# Altium schematic sheet 01_CPU_Core.SchDoc
size A1; SheetNumber: 12; SheetTotal: 12; SPICEModelCacheKMGZATEG: <root> / <DocumentId>KMGZATEG</DocumentId> / </root>
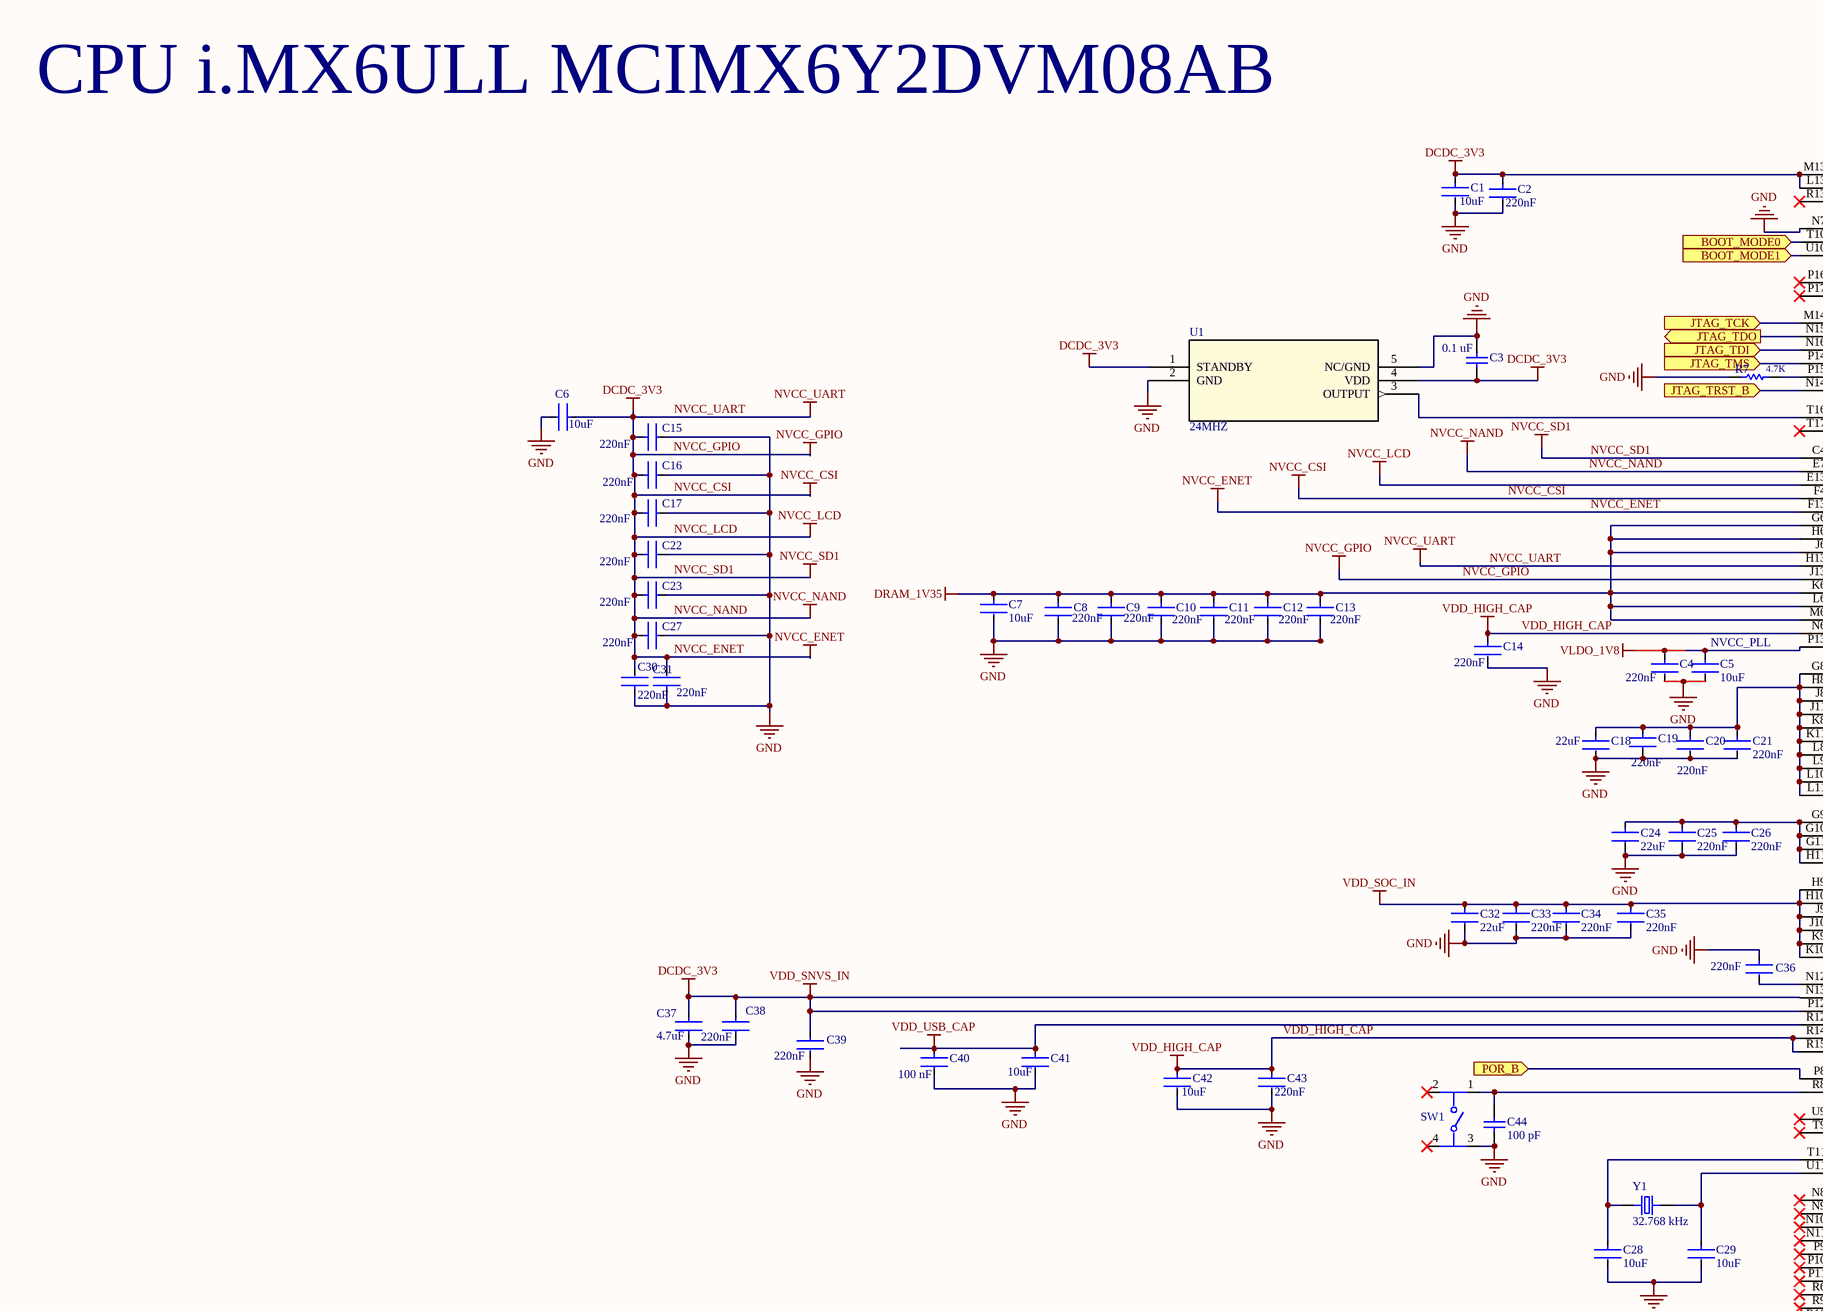
[diagram p0: 01_CPU_Core.SchDoc, top left]
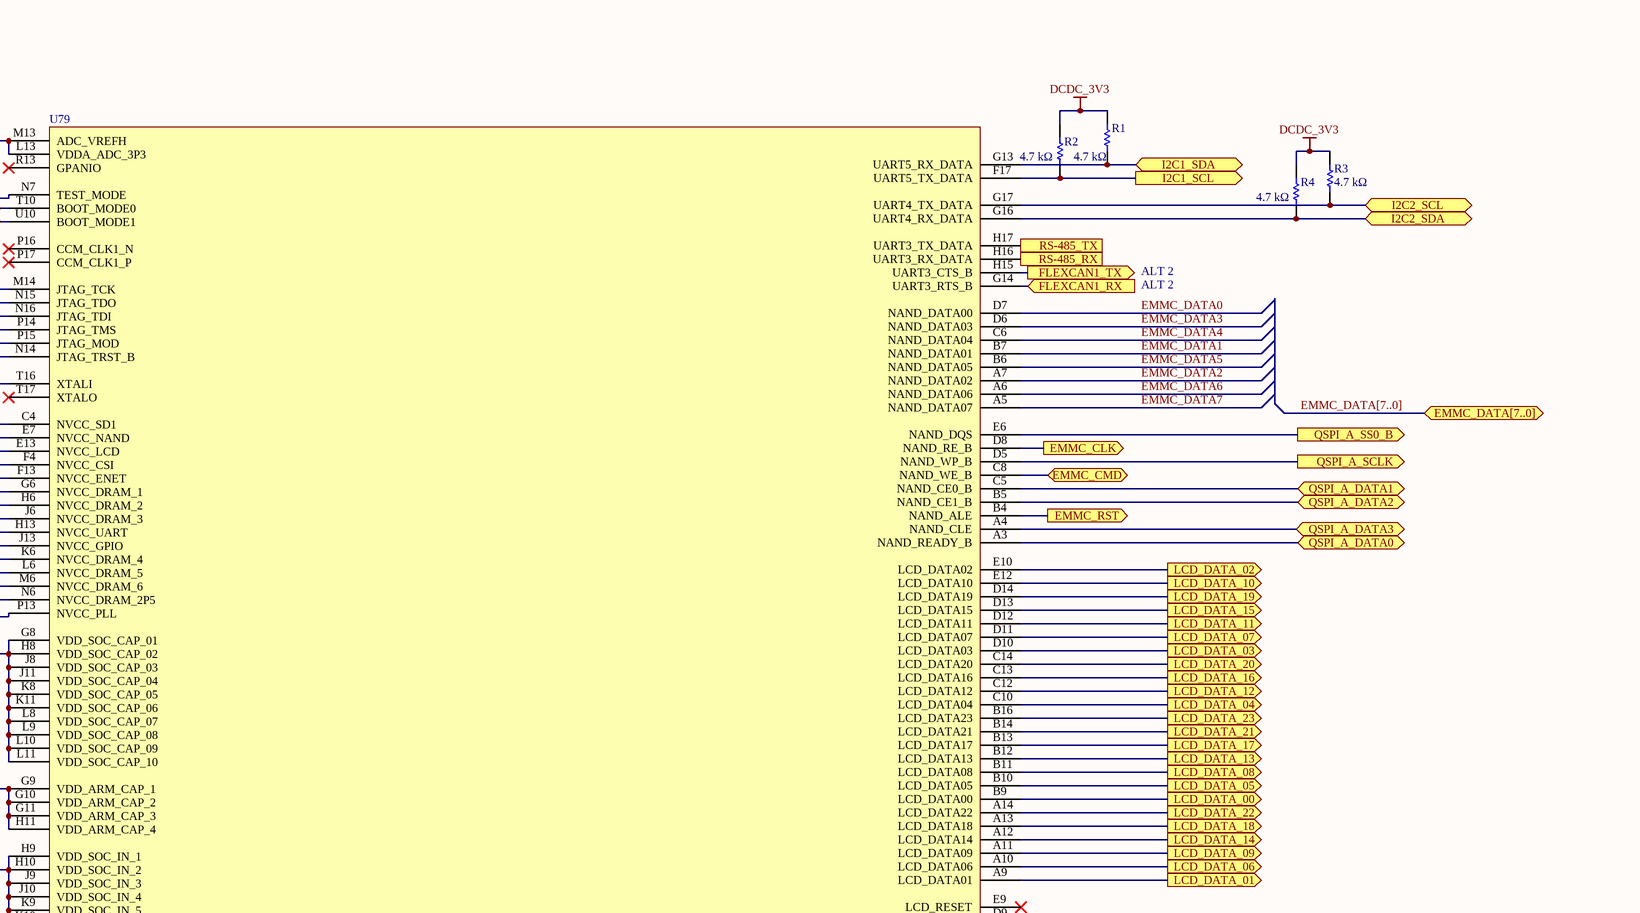
[diagram p1: 01_CPU_Core.SchDoc, top right]
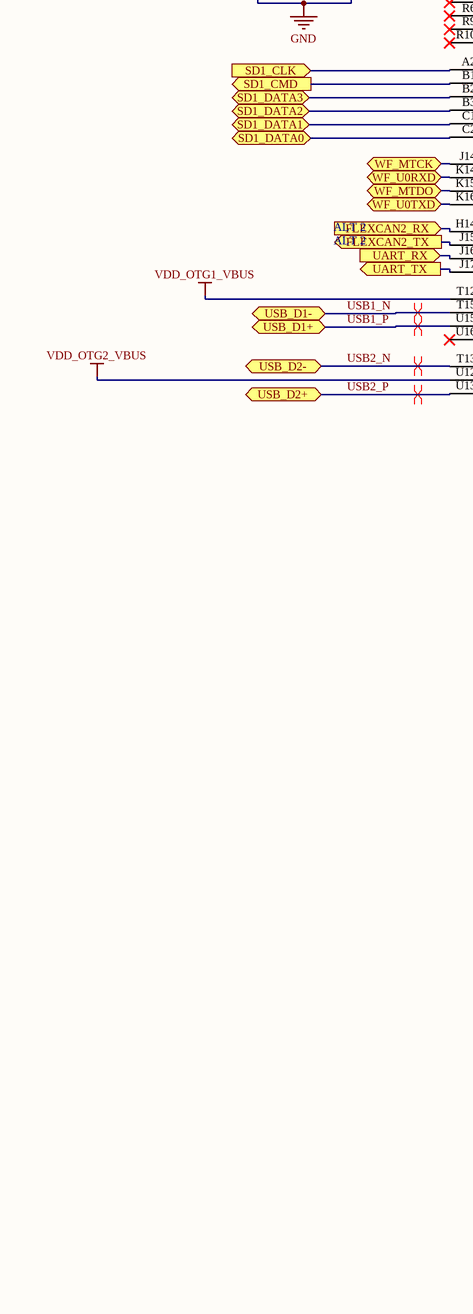
[diagram p2: 01_CPU_Core.SchDoc, bottom left]
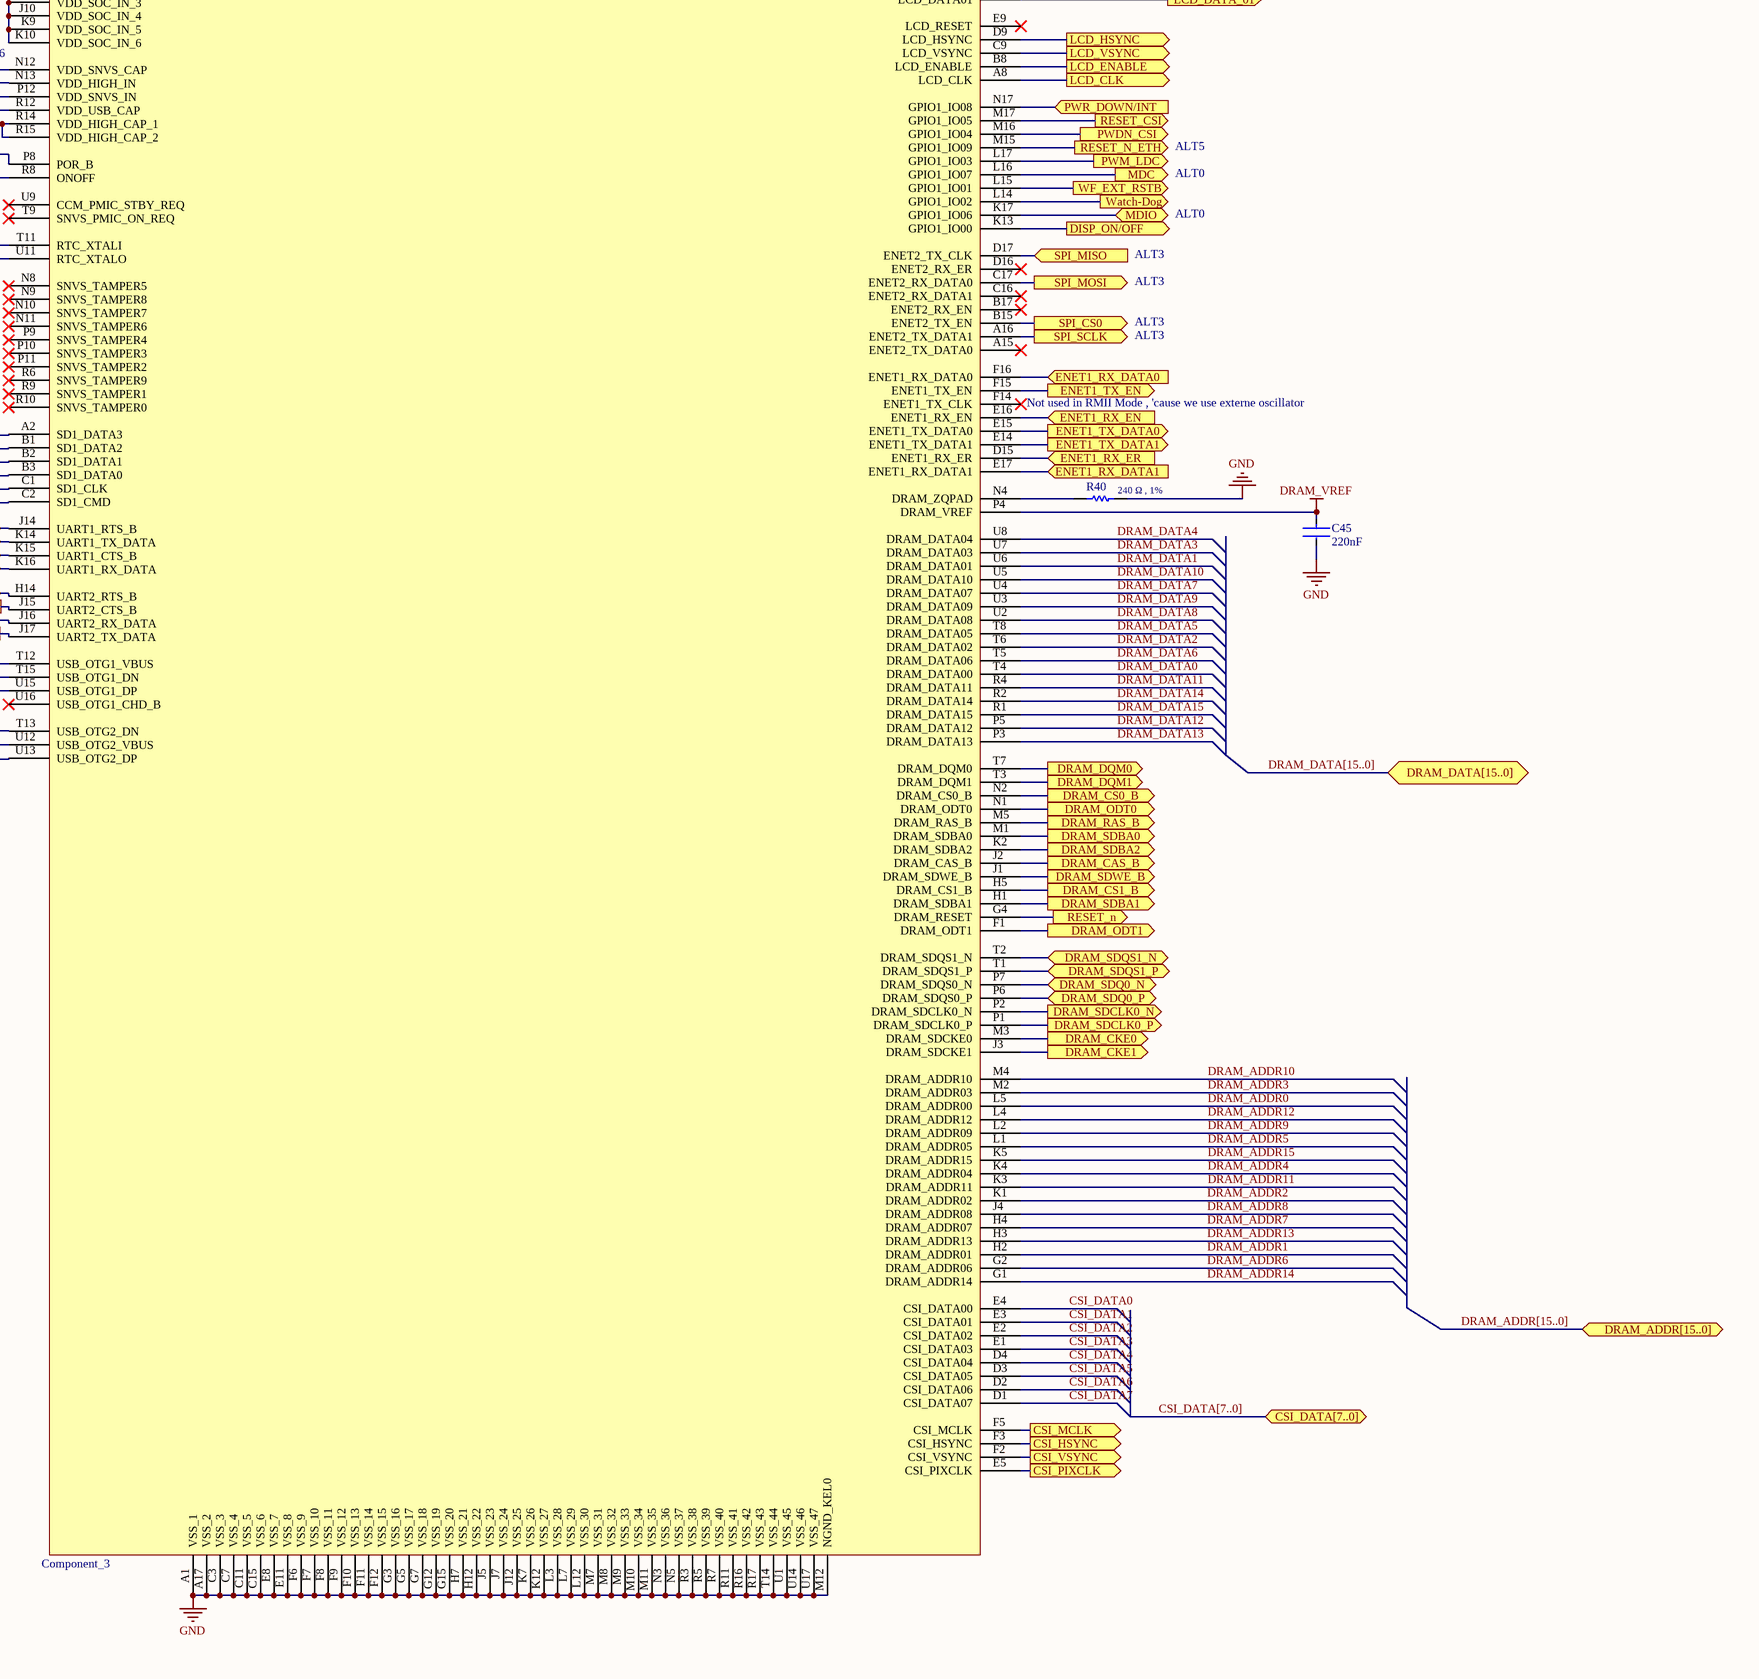
[diagram p3: 01_CPU_Core.SchDoc, bottom right]

## Parts
C1  10uF  [FP-CC0603-DC-IPC_C]
C2  220nF  [FP-CC0603-DA-MFG]
C3  0.1 uF  [CAPC1608X90X35ML10T15]
C4  220nF  [FP-CC0603-DA-MFG]
C5  10uF  [FP-CC0603-DC-IPC_C]
C6  10uF  [FP-CC0603-DC-IPC_C]
C7  10uF  [FP-CC0603-DC-IPC_C]
C8  220nF  [FP-CC0603-DA-MFG]
C9  220nF  [FP-CC0603-DA-MFG]
C10  220nF  [FP-CC0603-DA-MFG]
C11  220nF  [FP-CC0603-DA-MFG]
C12  220nF  [FP-CC0603-DA-MFG]
C13  220nF  [FP-CC0603-DA-MFG]
C14  220nF  [FP-CC0603-DA-MFG]
C15  220nF  [FP-CC0603-DA-MFG]
C16  220nF  [FP-CC0603-DA-MFG]
C17  220nF  [FP-CC0603-DA-MFG]
C18  22uF  [FP-CC0603-DC-MFG]
C19  220nF  [FP-CC0603-DA-MFG]
C20  220nF  [FP-CC0603-DA-MFG]
C21  220nF  [FP-CC0603-DA-MFG]
C22  220nF  [FP-CC0603-DA-MFG]
C23  220nF  [FP-CC0603-DA-MFG]
C24  22uF  [FP-CC0603-DC-MFG]
C25  220nF  [FP-CC0603-DA-MFG]
C26  220nF  [FP-CC0603-DA-MFG]
C27  220nF  [FP-CC0603-DA-MFG]
C28  10uF  [FP-CC0603-DC-IPC_C]
C29  10uF  [FP-CC0603-DC-IPC_C]
C30  220nF  [FP-CC0603-DA-MFG]
C31  220nF  [FP-CC0603-DA-MFG]
C32  22uF  [FP-CC0603-DC-MFG]
C33  220nF  [FP-CC0603-DA-MFG]
C34  220nF  [FP-CC0603-DA-MFG]
C35  220nF  [FP-CC0603-DA-MFG]
C36  220nF  [FP-CC0603-DA-MFG]
C37  4.7uF  [FP-CC0603-DA-MFG]
C38  220nF  [FP-CC0603-DA-MFG]
C39  220nF  [FP-CC0603-DA-MFG]
C40  100 nF  [FP-CC0603-DA-MFG]
C41  10uF  [FP-CC0603-DC-IPC_C]
C42  10uF  [FP-CC0603-DC-IPC_C]
C43  220nF  [FP-CC0603-DA-MFG]
C44  100 pF  [CAPC1608X90X40ML10T20]
C45  220nF  [FP-CC0603-DA-MFG]
R1  4.7 kΩ  [RESC1608X55X25LL10T15]
R2  4.7 kΩ  [RESC1608X55X25LL10T15]
R3  4.7 kΩ  [RESC1608X55X25LL10T15]
R4  4.7 kΩ  [RESC1608X55X25LL10T15]
R7  4.7K  [RESC1608X55X25LL10T15]
R40  240 Ω , 1%  [RESC0603(1608)_L]
SW1  (no value)  [PTS645SM43SMTR92LFS_MFG]
U1  24MHZ  [ASVMB_ABR]
U79  Component_3  [LFBGA289_SOT1534-2_NXP]
Y1  32.768 kHz  [XTAL_ECS-.327-6-34RR-TR]

## Ports
BOOT_MODE0 (in), BOOT_MODE1 (in), CSI_DATA[7..0] (bidir), CSI_HSYNC (out), CSI_MCLK (out), CSI_PIXCLK (out), CSI_VSYNC (out), DISP_ON/OFF (out), DRAM_ADDR[15..0] (bidir), DRAM_CAS_B (out), DRAM_CKE0 (out), DRAM_CKE1 (out), DRAM_CS0_B (out), DRAM_CS1_B (out), DRAM_DATA[15..0] (bidir), DRAM_DQM0 (out), DRAM_DQM1 (out), DRAM_ODT0 (out), DRAM_ODT1 (out), DRAM_RAS_B (out), DRAM_SDBA0 (out), DRAM_SDBA1 (out), DRAM_SDBA2 (out), DRAM_SDCLK0_N (out), DRAM_SDCLK0_P (out), DRAM_SDQ0_N (bidir), DRAM_SDQ0_P (bidir), DRAM_SDQS1_N (bidir), DRAM_SDQS1_P (bidir), DRAM_SDWE_B (out), EMMC_CLK (out), EMMC_CMD (bidir), EMMC_DATA[7..0] (bidir), EMMC_RST (out), ENET1_RX_DATA0 (in), ENET1_RX_DATA1 (in), ENET1_RX_EN (in), ENET1_RX_ER (in), ENET1_TX_DATA0 (out), ENET1_TX_DATA1 (out), ENET1_TX_EN (out), FLEXCAN1_RX (in), FLEXCAN1_TX (out), FLEXCAN2_RX (in), FLEXCAN2_TX (out), I2C1_SCL (out), I2C1_SDA (bidir), I2C2_SCL (bidir), I2C2_SDA (bidir), JTAG_TCK (in), JTAG_TDI (in), JTAG_TDO (out), JTAG_TMS (in), JTAG_TRST_B (in), LCD_CLK (out), LCD_DATA_00 (out), LCD_DATA_01 (out), LCD_DATA_02 (out), LCD_DATA_03 (out), LCD_DATA_04 (out), LCD_DATA_05 (out), LCD_DATA_06 (out), LCD_DATA_07 (out), LCD_DATA_08 (out), LCD_DATA_09 (out), LCD_DATA_10 (out), LCD_DATA_11 (out), LCD_DATA_12 (out), LCD_DATA_13 (out), LCD_DATA_14 (out), LCD_DATA_15 (out), LCD_DATA_16 (out), LCD_DATA_17 (out), LCD_DATA_18 (out), LCD_DATA_19 (out), LCD_DATA_20 (out), LCD_DATA_21 (out), LCD_DATA_22 (out), LCD_DATA_23 (out), LCD_ENABLE (out), LCD_HSYNC (out), LCD_VSYNC (out), MDC (out), MDIO (bidir), POR_B (in), PWDN_CSI (out), PWM_LDC (out), PWR_DOWN/INT (in), QSPI_A_DATA0 (bidir), QSPI_A_DATA1 (bidir), QSPI_A_DATA2 (bidir), QSPI_A_DATA3 (bidir), QSPI_A_SCLK (out), QSPI_A_SS0_B (out), RESET_CSI (out), RESET_n (out), RESET_N_ETH (out), RS-485_RX (in), RS-485_TX (out), SD1_CLK (in), SD1_CMD (out), SD1_DATA0 (bidir), SD1_DATA1 (bidir), SD1_DATA2 (bidir), SD1_DATA3 (bidir), SPI_CS0 (out), SPI_MISO (in), SPI_MOSI (out), SPI_SCLK (out), UART_RX (in), UART_TX (out), USB_D1+ (bidir), USB_D1- (bidir), USB_D2+ (bidir), USB_D2- (bidir), Watch-Dog (out), WF_EXT_RSTB (out), WF_MTCK (bidir), WF_MTDO (bidir), WF_U0RXD (bidir), WF_U0TXD (bidir)

## Nets
DRAM_1V35: C7.1 C8.1 C9.1 C10.1 C11.1 C12.1 C13.1 U79.G6(NVCC_DRAM_1) U79.H6(NVCC_DRAM_2) U79.J6(NVCC_DRAM_3) U79.K6(NVCC_DRAM_4) U79.L6(NVCC_DRAM_5) U79.M6(NVCC_DRAM_6)
DRAM_VREF: C45.1 U79.P4(DRAM_VREF)
GND: C1.2 C2.2 C3.2 C4.2 C5.2 C6.2 C7.2 C8.2 C9.2 C10.2 C11.2 C12.2 C13.2 C14.2 C15.2 C16.2 C17.2 C18.2 C19.2 C20.2 C21.2 C22.2 C23.2 C24.2 C25.2 C26.2 C27.2 C28.2 C29.2 C30.1 C31.1 C32.2 C33.2 C34.2 C35.2 C36.1 C37.2 C38.2 C39.2 C40.2 C41.2 C42.2 C43.2 C44.1 C45.2 R7.1 R40.2 SW1.3 U1.2(GND) U1.5(NC/GND) U79.A1(VSS_1) U79.A17(VSS_2) U79.C3(VSS_3) U79.C7(VSS_4) U79.C11(VSS_5) U79.C15(VSS_6) U79.E8(VSS_7) U79.E11(VSS_8) U79.F6(VSS_9) U79.F7(VSS_10) U79.F8(VSS_11) U79.F9(VSS_12) U79.F10(VSS_13) U79.F11(VSS_14) U79.F12(VSS_15) U79.G3(VSS_16) U79.G5(VSS_17) U79.G7(VSS_18) U79.G12(VSS_19) U79.G15(VSS_20) U79.H7(VSS_21) U79.H12(VSS_22) U79.J5(VSS_23) U79.J7(VSS_24) U79.J12(VSS_25) U79.K7(VSS_26) U79.K12(VSS_27) U79.L3(VSS_28) U79.L7(VSS_29) U79.L12(VSS_30) U79.M7(VSS_31) U79.M8(VSS_32) U79.M9(VSS_33) U79.M10(VSS_34) U79.M11(VSS_35) U79.M12(NGND_KEL0) U79.N3(VSS_36) U79.N5(VSS_37) U79.N7(TEST_MODE) U79.R3(VSS_38) U79.R5(VSS_39) U79.R7(VSS_40) U79.R11(VSS_41) U79.R16(VSS_42) U79.R17(VSS_43) U79.T14(VSS_44) U79.U1(VSS_45) U79.U14(VSS_46) U79.U17(VSS_47)
NVCC_CSI: C1.1 C2.1 C3.1 C6.1 C15.1 C16.1 C17.1 C22.1 C23.1 C27.1 C30.2 C31.2 C37.1 C38.1 C39.1 R1.2 R2.2 R3.2 R4.2 U1.1(STANDBY) U1.4(VDD) U79.C4(NVCC_SD1) U79.E7(NVCC_NAND) U79.E13(NVCC_LCD) U79.F4(NVCC_CSI) U79.F13(NVCC_ENET) U79.H13(NVCC_UART) U79.J13(NVCC_GPIO) U79.L13(VDDA_ADC_3P3) U79.M13(ADC_VREFH) U79.N13(VDD_HIGH_IN) U79.P12(VDD_SNVS_IN)  [also labelled DCDC_3V3, NVCC_ENET, NVCC_GPIO, NVCC_LCD, NVCC_NAND, NVCC_SD1, NVCC_UART, VDD_SNVS_IN]
VDD_HIGH_CAP: C14.1 C42.1 C43.1 U79.N6(NVCC_DRAM_2P5) U79.R14(VDD_HIGH_CAP_1) U79.R15(VDD_HIGH_CAP_2)
VDD_OTG1_VBUS: U79.T12(USB_OTG1_VBUS)
VDD_OTG2_VBUS: U79.U12(USB_OTG2_VBUS)
VDD_SOC_IN: C32.1 C33.1 C34.1 C35.1 U79.H9(VDD_SOC_IN_1) U79.H10(VDD_SOC_IN_2) U79.J9(VDD_SOC_IN_3) U79.J10(VDD_SOC_IN_4) U79.K9(VDD_SOC_IN_5) U79.K10(VDD_SOC_IN_6)
VDD_USB_CAP: C40.1 C41.1 U79.R12(VDD_USB_CAP)
VLDO_1V8: C4.1 C5.1 U79.P13(NVCC_PLL)
BOOT_MODE0: U79.T10(BOOT_MODE0) ; port BOOT_MODE0
BOOT_MODE1: U79.U10(BOOT_MODE1) ; port BOOT_MODE1
CSI_DATA0: U79.E4(CSI_DATA00)
CSI_DATA1: U79.E3(CSI_DATA01)
CSI_DATA2: U79.E2(CSI_DATA02)
CSI_DATA3: U79.E1(CSI_DATA03)
CSI_DATA4: U79.D4(CSI_DATA04)
CSI_DATA5: U79.D3(CSI_DATA05)
CSI_DATA6: U79.D2(CSI_DATA06)
CSI_DATA7: U79.D1(CSI_DATA07)
CSI_HSYNC: U79.F3(CSI_HSYNC) ; port CSI_HSYNC
CSI_MCLK: U79.F5(CSI_MCLK) ; port CSI_MCLK
CSI_PIXCLK: U79.E5(CSI_PIXCLK) ; port CSI_PIXCLK
CSI_VSYNC: U79.F2(CSI_VSYNC) ; port CSI_VSYNC
DISP_ON/OFF: U79.K13(GPIO1_IO00) ; port DISP_ON/OFF
DRAM_ADDR0: U79.L5(DRAM_ADDR00)
DRAM_ADDR1: U79.H2(DRAM_ADDR01)
DRAM_ADDR2: U79.K1(DRAM_ADDR02)
DRAM_ADDR3: U79.M2(DRAM_ADDR03)
DRAM_ADDR4: U79.K4(DRAM_ADDR04)
DRAM_ADDR5: U79.L1(DRAM_ADDR05)
DRAM_ADDR6: U79.G2(DRAM_ADDR06)
DRAM_ADDR7: U79.H4(DRAM_ADDR07)
DRAM_ADDR8: U79.J4(DRAM_ADDR08)
DRAM_ADDR9: U79.L2(DRAM_ADDR09)
DRAM_ADDR10: U79.M4(DRAM_ADDR10)
DRAM_ADDR11: U79.K3(DRAM_ADDR11)
DRAM_ADDR12: U79.L4(DRAM_ADDR12)
DRAM_ADDR13: U79.H3(DRAM_ADDR13)
DRAM_ADDR14: U79.G1(DRAM_ADDR14)
DRAM_ADDR15: U79.K5(DRAM_ADDR15)
DRAM_CAS_B: U79.J2(DRAM_CAS_B) ; port DRAM_CAS_B
DRAM_CKE0: U79.M3(DRAM_SDCKE0) ; port DRAM_CKE0
DRAM_CKE1: U79.J3(DRAM_SDCKE1) ; port DRAM_CKE1
DRAM_CS0_B: U79.N2(DRAM_CS0_B) ; port DRAM_CS0_B
DRAM_CS1_B: U79.H5(DRAM_CS1_B) ; port DRAM_CS1_B
DRAM_DATA0: U79.T4(DRAM_DATA00)
DRAM_DATA1: U79.U6(DRAM_DATA01)
DRAM_DATA2: U79.T6(DRAM_DATA02)
DRAM_DATA3: U79.U7(DRAM_DATA03)
DRAM_DATA4: U79.U8(DRAM_DATA04)
DRAM_DATA5: U79.T8(DRAM_DATA05)
DRAM_DATA6: U79.T5(DRAM_DATA06)
DRAM_DATA7: U79.U4(DRAM_DATA07)
DRAM_DATA8: U79.U2(DRAM_DATA08)
DRAM_DATA9: U79.U3(DRAM_DATA09)
DRAM_DATA10: U79.U5(DRAM_DATA10)
DRAM_DATA11: U79.R4(DRAM_DATA11)
DRAM_DATA12: U79.P5(DRAM_DATA12)
DRAM_DATA13: U79.P3(DRAM_DATA13)
DRAM_DATA14: U79.R2(DRAM_DATA14)
DRAM_DATA15: U79.R1(DRAM_DATA15)
DRAM_DQM0: U79.T7(DRAM_DQM0) ; port DRAM_DQM0
DRAM_DQM1: U79.T3(DRAM_DQM1) ; port DRAM_DQM1
DRAM_ODT0: U79.N1(DRAM_ODT0) ; port DRAM_ODT0
DRAM_ODT1: U79.F1(DRAM_ODT1) ; port DRAM_ODT1
DRAM_RAS_B: U79.M5(DRAM_RAS_B) ; port DRAM_RAS_B
DRAM_SDBA0: U79.M1(DRAM_SDBA0) ; port DRAM_SDBA0
DRAM_SDBA1: U79.H1(DRAM_SDBA1) ; port DRAM_SDBA1
DRAM_SDBA2: U79.K2(DRAM_SDBA2) ; port DRAM_SDBA2
DRAM_SDCLK0_N: U79.P2(DRAM_SDCLK0_N) ; port DRAM_SDCLK0_N
DRAM_SDCLK0_P: U79.P1(DRAM_SDCLK0_P) ; port DRAM_SDCLK0_P
DRAM_SDQ0_N: U79.P7(DRAM_SDQS0_N) ; port DRAM_SDQ0_N
DRAM_SDQ0_P: U79.P6(DRAM_SDQS0_P) ; port DRAM_SDQ0_P
DRAM_SDQS1_N: U79.T2(DRAM_SDQS1_N) ; port DRAM_SDQS1_N
DRAM_SDQS1_P: U79.T1(DRAM_SDQS1_P) ; port DRAM_SDQS1_P
DRAM_SDWE_B: U79.J1(DRAM_SDWE_B) ; port DRAM_SDWE_B
EMMC_CLK: U79.D8(NAND_RE_B) ; port EMMC_CLK
EMMC_CMD: U79.C8(NAND_WE_B) ; port EMMC_CMD
EMMC_DATA0: U79.D7(NAND_DATA00)
EMMC_DATA1: U79.B7(NAND_DATA01)
EMMC_DATA2: U79.A7(NAND_DATA02)
EMMC_DATA3: U79.D6(NAND_DATA03)
EMMC_DATA4: U79.C6(NAND_DATA04)
EMMC_DATA5: U79.B6(NAND_DATA05)
EMMC_DATA6: U79.A6(NAND_DATA06)
EMMC_DATA7: U79.A5(NAND_DATA07)
EMMC_RST: U79.B4(NAND_ALE) ; port EMMC_RST
ENET1_RX_DATA0: U79.F16(ENET1_RX_DATA0) ; port ENET1_RX_DATA0
ENET1_RX_DATA1: U79.E17(ENET1_RX_DATA1) ; port ENET1_RX_DATA1
ENET1_RX_EN: U79.E16(ENET1_RX_EN) ; port ENET1_RX_EN
ENET1_RX_ER: U79.D15(ENET1_RX_ER) ; port ENET1_RX_ER
ENET1_TX_DATA0: U79.E15(ENET1_TX_DATA0) ; port ENET1_TX_DATA0
ENET1_TX_DATA1: U79.E14(ENET1_TX_DATA1) ; port ENET1_TX_DATA1
ENET1_TX_EN: U79.F15(ENET1_TX_EN) ; port ENET1_TX_EN
FLEXCAN1_RX: U79.G14(UART3_RTS_B) ; port FLEXCAN1_RX
FLEXCAN1_TX: U79.H15(UART3_CTS_B) ; port FLEXCAN1_TX
FLEXCAN2_RX: U79.H14(UART2_RTS_B) ; port FLEXCAN2_RX
FLEXCAN2_TX: U79.J15(UART2_CTS_B) ; port FLEXCAN2_TX
I2C1_SCL: R2.1 U79.F17(UART5_TX_DATA) ; port I2C1_SCL
I2C1_SDA: R1.1 U79.G13(UART5_RX_DATA) ; port I2C1_SDA
I2C2_SCL: R3.1 U79.G17(UART4_TX_DATA) ; port I2C2_SCL
I2C2_SDA: R4.1 U79.G16(UART4_RX_DATA) ; port I2C2_SDA
JTAG_TCK: U79.M14(JTAG_TCK) ; port JTAG_TCK
JTAG_TDI: U79.N16(JTAG_TDI) ; port JTAG_TDI
JTAG_TDO: U79.N15(JTAG_TDO) ; port JTAG_TDO
JTAG_TMS: U79.P14(JTAG_TMS) ; port JTAG_TMS
JTAG_TRST_B: U79.N14(JTAG_TRST_B) ; port JTAG_TRST_B
LCD_CLK: U79.A8(LCD_CLK) ; port LCD_CLK
LCD_DATA_00: U79.B9(LCD_DATA00) ; port LCD_DATA_00
LCD_DATA_01: U79.A9(LCD_DATA01) ; port LCD_DATA_01
LCD_DATA_02: U79.E10(LCD_DATA02) ; port LCD_DATA_02
LCD_DATA_03: U79.D10(LCD_DATA03) ; port LCD_DATA_03
LCD_DATA_04: U79.C10(LCD_DATA04) ; port LCD_DATA_04
LCD_DATA_05: U79.B10(LCD_DATA05) ; port LCD_DATA_05
LCD_DATA_06: U79.A10(LCD_DATA06) ; port LCD_DATA_06
LCD_DATA_07: U79.D11(LCD_DATA07) ; port LCD_DATA_07
LCD_DATA_08: U79.B11(LCD_DATA08) ; port LCD_DATA_08
LCD_DATA_09: U79.A11(LCD_DATA09) ; port LCD_DATA_09
LCD_DATA_10: U79.E12(LCD_DATA10) ; port LCD_DATA_10
LCD_DATA_11: U79.D12(LCD_DATA11) ; port LCD_DATA_11
LCD_DATA_12: U79.C12(LCD_DATA12) ; port LCD_DATA_12
LCD_DATA_13: U79.B12(LCD_DATA13) ; port LCD_DATA_13
LCD_DATA_14: U79.A12(LCD_DATA14) ; port LCD_DATA_14
LCD_DATA_15: U79.D13(LCD_DATA15) ; port LCD_DATA_15
LCD_DATA_16: U79.C13(LCD_DATA16) ; port LCD_DATA_16
LCD_DATA_17: U79.B13(LCD_DATA17) ; port LCD_DATA_17
LCD_DATA_18: U79.A13(LCD_DATA18) ; port LCD_DATA_18
LCD_DATA_19: U79.D14(LCD_DATA19) ; port LCD_DATA_19
LCD_DATA_20: U79.C14(LCD_DATA20) ; port LCD_DATA_20
LCD_DATA_21: U79.B14(LCD_DATA21) ; port LCD_DATA_21
LCD_DATA_22: U79.A14(LCD_DATA22) ; port LCD_DATA_22
LCD_DATA_23: U79.B16(LCD_DATA23) ; port LCD_DATA_23
LCD_ENABLE: U79.B8(LCD_ENABLE) ; port LCD_ENABLE
LCD_HSYNC: U79.D9(LCD_HSYNC) ; port LCD_HSYNC
LCD_VSYNC: U79.C9(LCD_VSYNC) ; port LCD_VSYNC
MDC: U79.L16(GPIO1_IO07) ; port MDC
MDIO: U79.K17(GPIO1_IO06) ; port MDIO
POR_B: U79.P8(POR_B) ; port POR_B
PWDN_CSI: U79.M16(GPIO1_IO04) ; port PWDN_CSI
PWM_LDC: U79.L17(GPIO1_IO03) ; port PWM_LDC
PWR_DOWN/INT: U79.N17(GPIO1_IO08) ; port PWR_DOWN/INT
QSPI_A_DATA0: U79.A3(NAND_READY_B) ; port QSPI_A_DATA0
QSPI_A_DATA1: U79.C5(NAND_CE0_B) ; port QSPI_A_DATA1
QSPI_A_DATA2: U79.B5(NAND_CE1_B) ; port QSPI_A_DATA2
QSPI_A_DATA3: U79.A4(NAND_CLE) ; port QSPI_A_DATA3
QSPI_A_SCLK: U79.D5(NAND_WP_B) ; port QSPI_A_SCLK
QSPI_A_SS0_B: U79.E6(NAND_DQS) ; port QSPI_A_SS0_B
RESET_CSI: U79.M17(GPIO1_IO05) ; port RESET_CSI
RESET_n: U79.G4(DRAM_RESET) ; port RESET_n
RESET_N_ETH: U79.M15(GPIO1_IO09) ; port RESET_N_ETH
RS-485_RX: U79.H16(UART3_RX_DATA) ; port RS-485_RX
RS-485_TX: U79.H17(UART3_TX_DATA) ; port RS-485_TX
SD1_CLK: U79.A2(SD1_DATA3) ; port SD1_CLK
SD1_CMD: U79.B1(SD1_DATA2) ; port SD1_CMD
SD1_DATA0: U79.C2(SD1_CMD) ; port SD1_DATA0
SD1_DATA1: U79.C1(SD1_CLK) ; port SD1_DATA1
SD1_DATA2: U79.B3(SD1_DATA0) ; port SD1_DATA2
SD1_DATA3: U79.B2(SD1_DATA1) ; port SD1_DATA3
SPI_CS0: U79.B15(ENET2_TX_EN) ; port SPI_CS0
SPI_MISO: U79.D17(ENET2_TX_CLK) ; port SPI_MISO
SPI_MOSI: U79.C17(ENET2_RX_DATA0) ; port SPI_MOSI
SPI_SCLK: U79.A16(ENET2_TX_DATA1) ; port SPI_SCLK
UART_RX: U79.J16(UART2_RX_DATA) ; port UART_RX
UART_TX: U79.J17(UART2_TX_DATA) ; port UART_TX
USB1_N: U79.T15(USB_OTG1_DN) ; port USB_D1-
USB1_P: U79.U15(USB_OTG1_DP) ; port USB_D1+
USB2_N: U79.T13(USB_OTG2_DN) ; port USB_D2-
USB2_P: U79.U13(USB_OTG2_DP) ; port USB_D2+
Watch-Dog: U79.L14(GPIO1_IO02) ; port Watch-Dog
WF_EXT_RSTB: U79.L15(GPIO1_IO01) ; port WF_EXT_RSTB
WF_MTCK: U79.J14(UART1_RTS_B) ; port WF_MTCK
WF_MTDO: U79.K15(UART1_CTS_B) ; port WF_MTDO
WF_U0RXD: U79.K14(UART1_TX_DATA) ; port WF_U0RXD
WF_U0TXD: U79.K16(UART1_RX_DATA) ; port WF_U0TXD
NetC18_1: C18.1 C19.1 C20.1 C21.1 U79.G8(VDD_SOC_CAP_01) U79.H8(VDD_SOC_CAP_02) U79.J8(VDD_SOC_CAP_03) U79.J11(VDD_SOC_CAP_04) U79.K8(VDD_SOC_CAP_05) U79.K11(VDD_SOC_CAP_06) U79.L8(VDD_SOC_CAP_07) U79.L9(VDD_SOC_CAP_08) U79.L10(VDD_SOC_CAP_09) U79.L11(VDD_SOC_CAP_10)
NetC24_1: C24.1 C25.1 C26.1 U79.G9(VDD_ARM_CAP_1) U79.G10(VDD_ARM_CAP_2) U79.G11(VDD_ARM_CAP_3) U79.H11(VDD_ARM_CAP_4)
NetC28_1: C28.1 U79.T11(RTC_XTALI) Y1.2(O/I)
NetC29_1: C29.1 U79.U11(RTC_XTALO) Y1.1(I/O)
NetC36_2: C36.2 U79.N12(VDD_SNVS_CAP)
NetC44_2: C44.2 SW1.1 U79.R8(ONOFF)
NetR7_2: R7.2 U79.P15(JTAG_MOD)
NetR40_1: R40.1 U79.N4(DRAM_ZQPAD)
NetU1_3: U1.3(OUTPUT) U79.T16(XTALI)

Not connected (* = marked no-connect by the designer): SW1 2* 4*; U79 A15(ENET2_TX_DATA0)* B17(ENET2_RX_EN)* C16(ENET2_RX_DATA1)* D16(ENET2_RX_ER)* E9(LCD_RESET)* F14(ENET1_TX_CLK)* N8(SNVS_TAMPER5)* N9(SNVS_TAMPER8)* N10(SNVS_TAMPER7)* N11(SNVS_TAMPER6)* P9(SNVS_TAMPER4)* P10(SNVS_TAMPER3)* P11(SNVS_TAMPER2)* P16(CCM_CLK1_N)* P17(CCM_CLK1_P)* R6(SNVS_TAMPER9)* R9(SNVS_TAMPER1)* R10(SNVS_TAMPER0)* R13(GPANIO)* T9(SNVS_PMIC_ON_REQ)* T17(XTALO)* U9(CCM_PMIC_STBY_REQ)* U16(USB_OTG1_CHD_B)*

## Buses and harness runs
bus CSI_DATA[7..0] = port CSI_DATA[7..0]
bus DRAM_ADDR[15..0] = port DRAM_ADDR[15..0]
bus DRAM_DATA[15..0] = port DRAM_DATA[15..0]
bus EMMC_DATA[7..0] = port EMMC_DATA[7..0]

## Layout directives
differential pair: USB1_N, USB1_P, USB2_N, USB2_P

## Notes on the sheet
- CPU i.MX6ULL MCIMX6Y2DVM08AB
- ALT 2
- (near C5) NVCC_PLL
- ALT0
- ALT5
- ALT3
- (near U79) Not used in RMII Mode , 'cause we use externe oscillator

## Library data of the parts
C1 C5-C7 C28 C29 C41 C42 = CMP-03422-001507-1: CAP CER 10UF 10V X5R 0603; Tolerance: 10%; Case/Package: 0603; Length: 0.063inch; Capacitance: 10uF; Dielectric: X5R; Mount: Surface Mount; Case Code (Metric): 1608; Depth: 0.8mm; Voltage Rating (DC): 10V; Voltage Rating: 10V; Lead Free: Lead Free; Resistor Type: Ceramic; Packaging: Tape and Reel; Max Operating Temperature: 85°C; Termination: SMD/SMT; Min Operating Temperature: -55°C; Weight: 7.1E-05oz; Thickness: 0.035inch; Case Code (Imperial): 0603; Package Quantity: 4000; Halogen Free: Halogen Free; RoHS Compliant: Yes; Width: 0.031inch
C2 C4 C8-C17 C19-C23 C25-C27 C30 C31 C33-C36 C38 C39 C43 C45 = CMP-03422-001373-1: 0.22µF 50V Ceramic Capacitor X7R 0603 (1608 Metric) 0.063" L x 0.031" W (1.60mm x 0.80mm); Manufacturer Part Number: CC0603KRX7R9BB224; Manufacturer: YAGEO; Tolerance: 0.1; Temperature Coefficient: 15%; ComponentLink2URL: http://www.yageo.com/documents/recent/UPY-GPHC_X7R_6.3V-to-50V_18.pdf; Temperature Range High: +125°C; Lead Free: Yes; Mouser Description: 0603 50 V 0.22 uF ±10% Tolerance X7R Multilayer Ceramic Capacitor; Material: Ceramic; Value: 220 nF; Temperature Range Low: -55°C; Digikey Description: 0.22µF 50V Ceramic Capacitor X7R 0603 (1608 Metric) 0.063" L x 0.031" W (1.60mm x 0.80mm); Device Class L3: Ceramic Capacitors; RoHS: TRUE; Octopart: https://octopart.com/cc0603krx7r9bb224-yageo-30314039; Package: CC0603-DA; Device Class L1: Passive Components; Automotive: No; Voltage: 50 V; Height: 0.9mm; Device Class L2: Capacitors; Voltage Rating: 50 V; Temperature: -55°C to +125°C; Footprint Url: http://www.yageo.com/exep/pages/download/literatures/UPY-C_GEN_24.pdf; Category: Cap; Capacitance: 220 nF; ComponentLink2Description: Datasheet; Temperature Characteristic: X7R
C3 = CMP-2006-02375-5: Chip Capacitor, 100 nF, +/- 10%, 50 V, -55 to 125 degC, 0603 (1608 Metric), RoHS, Tape and Reel; Manufacturer: Murata; Voltage Rating: 50 V; Min Operating Temperature: -55 degC; ComponentLink1URL: http://www.murata.com/; PackageReference: 0603; Max Operating Temperature: 125 degC; ComponentLink1Description: Manufacturer URL; ComponentLink2Description: Datasheet; Packaging: Tape and Reel; PackageDescription: 2-Pin Surface Mount Device, Body 1.6 x 0.8 mm; Height: 0.8 mm; Mounting Technology: Surface Mount; Mount: Surface Mount; Length: 1.6 mm; ComponentLink2URL: http://psearch.en.murata.com/capacitor/product/GCM188R71H104KA57%23.pdf; Package Quantity: 4000; REACH SVHC: No SVHC; RoHSCompliant: true; DatasheetVersion: 07/2016
C18 C24 C32 = CMP-2000-06075-2: CAP CER 22UF 6.3V X5R 0603; Tolerance: 20%; Termination: SMD/SMT; Mount: Surface Mount; Depth: 0.8mm; Thickness: 0.035inch; Packaging: Tape and Reel; RoHS Compliant: Yes; Case/Package: 0603; Min Operating Temperature: -55°C; Package Quantity: 4000; Weight: 7.1E-05oz; Max Operating Temperature: 85°C; Voltage Rating (DC): 6.3V; Halogen Free: Halogen Free; Lead Free: Lead Free; Resistor Type: Ceramic; Case Code (Imperial): 0603; Width: 0.031inch; Case Code (Metric): 1608; Voltage Rating: 6.3V; Length: 0.063inch; Capacitance: 22uF; Dielectric: X5R
C37 = CMP-2000-06074-2: CAP CER 4.7UF 10V X5R 0603; Manufacturer Part Number: CC0603KRX5R6BB475; Manufacturer: YAGEO; Temperature Coefficient: 15%; Tolerance: 0.1; Material: Ceramic; Voltage Rating: 10 V; ComponentLink2URL: http://www.yageo.com/documents/recent/UPY-GPHC_X7R_6.3V-to-50V_18.pdf; Package: CC0603-DA; Temperature Range High: +125°C; Category: Cap; ComponentLink2Description: Datasheet; Lead Free: Yes; Mouser Description: 4.7µF Surface Mount, MLCC 0603 (1608 Metric) Package Ceramic Capacitors; Device Class L2: Capacitors; Temperature Characteristic: X5R; Voltage: 10 V; RoHS: TRUE; Octopart: https://octopart.com/cc0603krx5r6bb475-yageo-9292507; Automotive: No; Height: 0.9mm; Temperature: -55°C to +125°C; Temperature Range Low: -55°C; Value: 4.7 uF; Digikey Description: CAP CER 4.7UF 10V X5R 0603; Device Class L1: Passive Components; Capacitance: 4.7 uF; Footprint Url: http://www.yageo.com/exep/pages/download/literatures/UPY-C_GEN_24.pdf; Device Class L3: Ceramic Capacitors
C40 = CMP-2100-03601-2: CAP CER 0.1UF 50V X7R 0603; Manufacturer: YAGEO; Manufacturer Part Number: CC0603KRX7R9BB104; Material: Ceramic; Temperature Coefficient: 15%; Tolerance: 0.1; Height: 0.9mm; Voltage: 50 V; ComponentLink2Description: Datasheet; Device Class L2: Capacitors; Temperature Range High: +125°C; Category: Cap; Capacitance: 100 nF; Footprint Url: http://www.yageo.com/exep/pages/download/literatures/UPY-C_GEN_24.pdf; ComponentLink2URL: http://www.yageo.com/documents/recent/UPY-GPHC_X7R_6.3V-to-50V_18.pdf; Package: CC0603-DA; Temperature: -55°C to +125°C; Voltage Rating: 50 V; Temperature Characteristic: X7R; Device Class L1: Passive Components; Temperature Range Low: -55°C; RoHS: TRUE; Automotive: No; Value: 100 nF; Device Class L3: Ceramic Capacitors; Octopart: https://octopart.com/cc0603krx7r9bb104-yageo-42244635; Mouser Description: Multilayer Ceramic Capacitor, CC Series, 0.1 - F, - 10%, X7R, 50 V, 0603 [1608 Metric]; Lead Free: Yes; Digikey Description: CAP CER 0.1UF 50V X7R 0603
C44 = CMP-2100-03594-1: Chip Capacitor, 100 pF, +/- 5%, 50 V, -55 to 125 degC, 0603 (1608 Metric), RoHS, Tape and Reel; Manufacturer: Yageo; Capacitance: 100pF; Voltage Rating (DC): 50V; Dielectric: C0G; Temperature Coefficient: 30ppm/degC; Insulation Resistance: 100GR; Datasheet Version: Rev. 14, 07/2016; Manufacturer URL: http://www.yageo.com/; Packaging: TapeandReel; Mount: SurfaceMount; RoHSCompliant: True; Package Reference: 0603; Tolerance: 5%; Max Operating Temperature: 125degC; Case Code (Imperial): 0603; Number of Pins: 2; Width: 0.8mm; Case Code (Metric): 1608; Voltage: 50V; REACH SVHC: Unknown; Package Description: 2-Pin Surface Mount Device, Body 1.6 x 0.8 mm; Composition: Ceramic; Lead Free: LeadFree; Min Operating Temperature: -55degC; Radiation Hardening: No; Depth: 0.8mm; Thickness: 0.035inch; Datasheet URL: http://www.yageo.com/documents/recent/UPY-GP_NP0_16V-to-50V_14.pdf; Termination: SMD/SMT; Package Quantity: 1; Length: 1.6mm; Voltage Rating: 50V; Height: 0.8mm; Case/Package: 0603
R1-R4 R7 = CMP-2000-06942-1: Chip Resistor, 4.7 KOhm, +/- 1%, 0.1 W, -55 to 155 degC, 0603 (1608 Metric), RoHS, Tape and Reel; Manufacturer: Yageo; Power Rating: 100mW; Temperature Coefficient: 100PPM/C; Resistance: 4.7kOhms; Voltage Rating: 50V; Package Reference: 0603; Series: RC; Datasheet Version: Rev. 7, 05/2017; Packaging: Reel; Termination Style: SMD/SMT; Datasheet URL: http://www.yageo.com/documents/recent/PYu-RC_Group_51_RoHS_L_7.pdf; Manufacturer URL: http://www.yageo.com/; Package Description: 2-Pin Surface Mount Device, Body 1.6 x 0.8 mm; Case Code - mm: 1608; Case Code - in: 0603; Mounting Technology: SurfaceMount; Operating Temperature Range: -55Cto+155C; Tolerance: 1%; Product: ThickFilmResistorsGeneralPurpose
R40 = CMP-1012-00438-1: 240R 0.1W 1% 0603 (1608 Metric)  SMD; Case-EIA: 0603; Value: 240.00 Ohm; Case-Metric: 1608; Technology: SMT; Power: 0.1 W; Tolerance: 1 %
SW1 = CMP-2000-05160-3: Switch Tactile N.O SPST Round Button Gull Wing 0.05A 12VDC 100000Cycle 1.57N SMD T/R; Manufacturer Package Identifier: PTS645SM43SMTR92LFS; Switch Function: Off-Mom; Life (Cycles): 100kcycles; Voltage Rating (DC): 12V; Actuator Material: Nylon, Polyamide; Max Current Rating: 50mA; Contact Resistance: 100mΩ; Number of Positions: 1; Actuator Length: 850µm; Illumination Type: Illuminated, Non-Illuminated; Insulation Resistance: 100GΩ; RoHS: Compliant; Electrical Life: 100kcycles; Lead Free: Lead Free; Contact Plating: Silver; Case/Package: SMD/SMT; Termination: Solder; Height: 3.45mm; ComponentLink1URL: http://www.ck-components.com/; Max Voltage Rating (DC): 12V; Lifecycle Status: Production; Min Operating Temperature: -20°C; Throw Configuration: SPST; China RoHS: Compliant; ComponentLink1Description: Manufacturer's Website; Operating Force: 1.57N; Depth: 9mm; Contact Material: Silver; Length: 6mm; Current Rating: 50mA; Color: Black; Contact Current Rating: 50mA; Mechanical Life: 100kcycles; ComponentLink2URL: https://www.ckswitches.com/media/1471/pts645.pdf; Orientation: Straight; Packaging: Cut Tape (CT); REACH SVHC: Yes; Max Operating Temperature: 60°C; ComponentLink2Description: Datasheet URL; HelpURL: https://www.ckswitches.com/media/1471/pts645.pdf; Mount: Surface Mount
U1 = ASVMB-24.000MHZ-LY-T: No Description Available; Manufacturer_Name: Abracon; Copyright: Copyright (C) 2026 Ultra Librarian. All rights reserved.; Manufacturer_Part_Number: ASVMB-24.000MHZ-LY-T; RefDes: RefDes; Type: Type
Y1 = ECS-.327-6-34RR-TR: 32.768kHz 20ppm Crystal 6pF 20 kOhm -40C ~ 85C Surface Mount 2-SMD, No Lead 3.2 x 1.5; MF: ECS Inc.; SnapEDA_Link: https://www.snapeda.com/parts/ECS-.327-6-34RR-TR/ECS/view-part/?ref=snap; Package: ECX-34RR-34RR-2 ECS; Value: *; MP: ECS-.327-6-34RR-TR; Check_prices: https://www.snapeda.com/parts/ECS-.327-6-34RR-TR/ECS/view-part/?ref=eda